# Altium project Servo-Driver-v2.0.PrjPcb (part 14 of 20)

## Sheet Controller-Comms-Sheet-2.SchDoc
size 420 x 297 mm; SheetNumber: 9; SheetTotal: 15
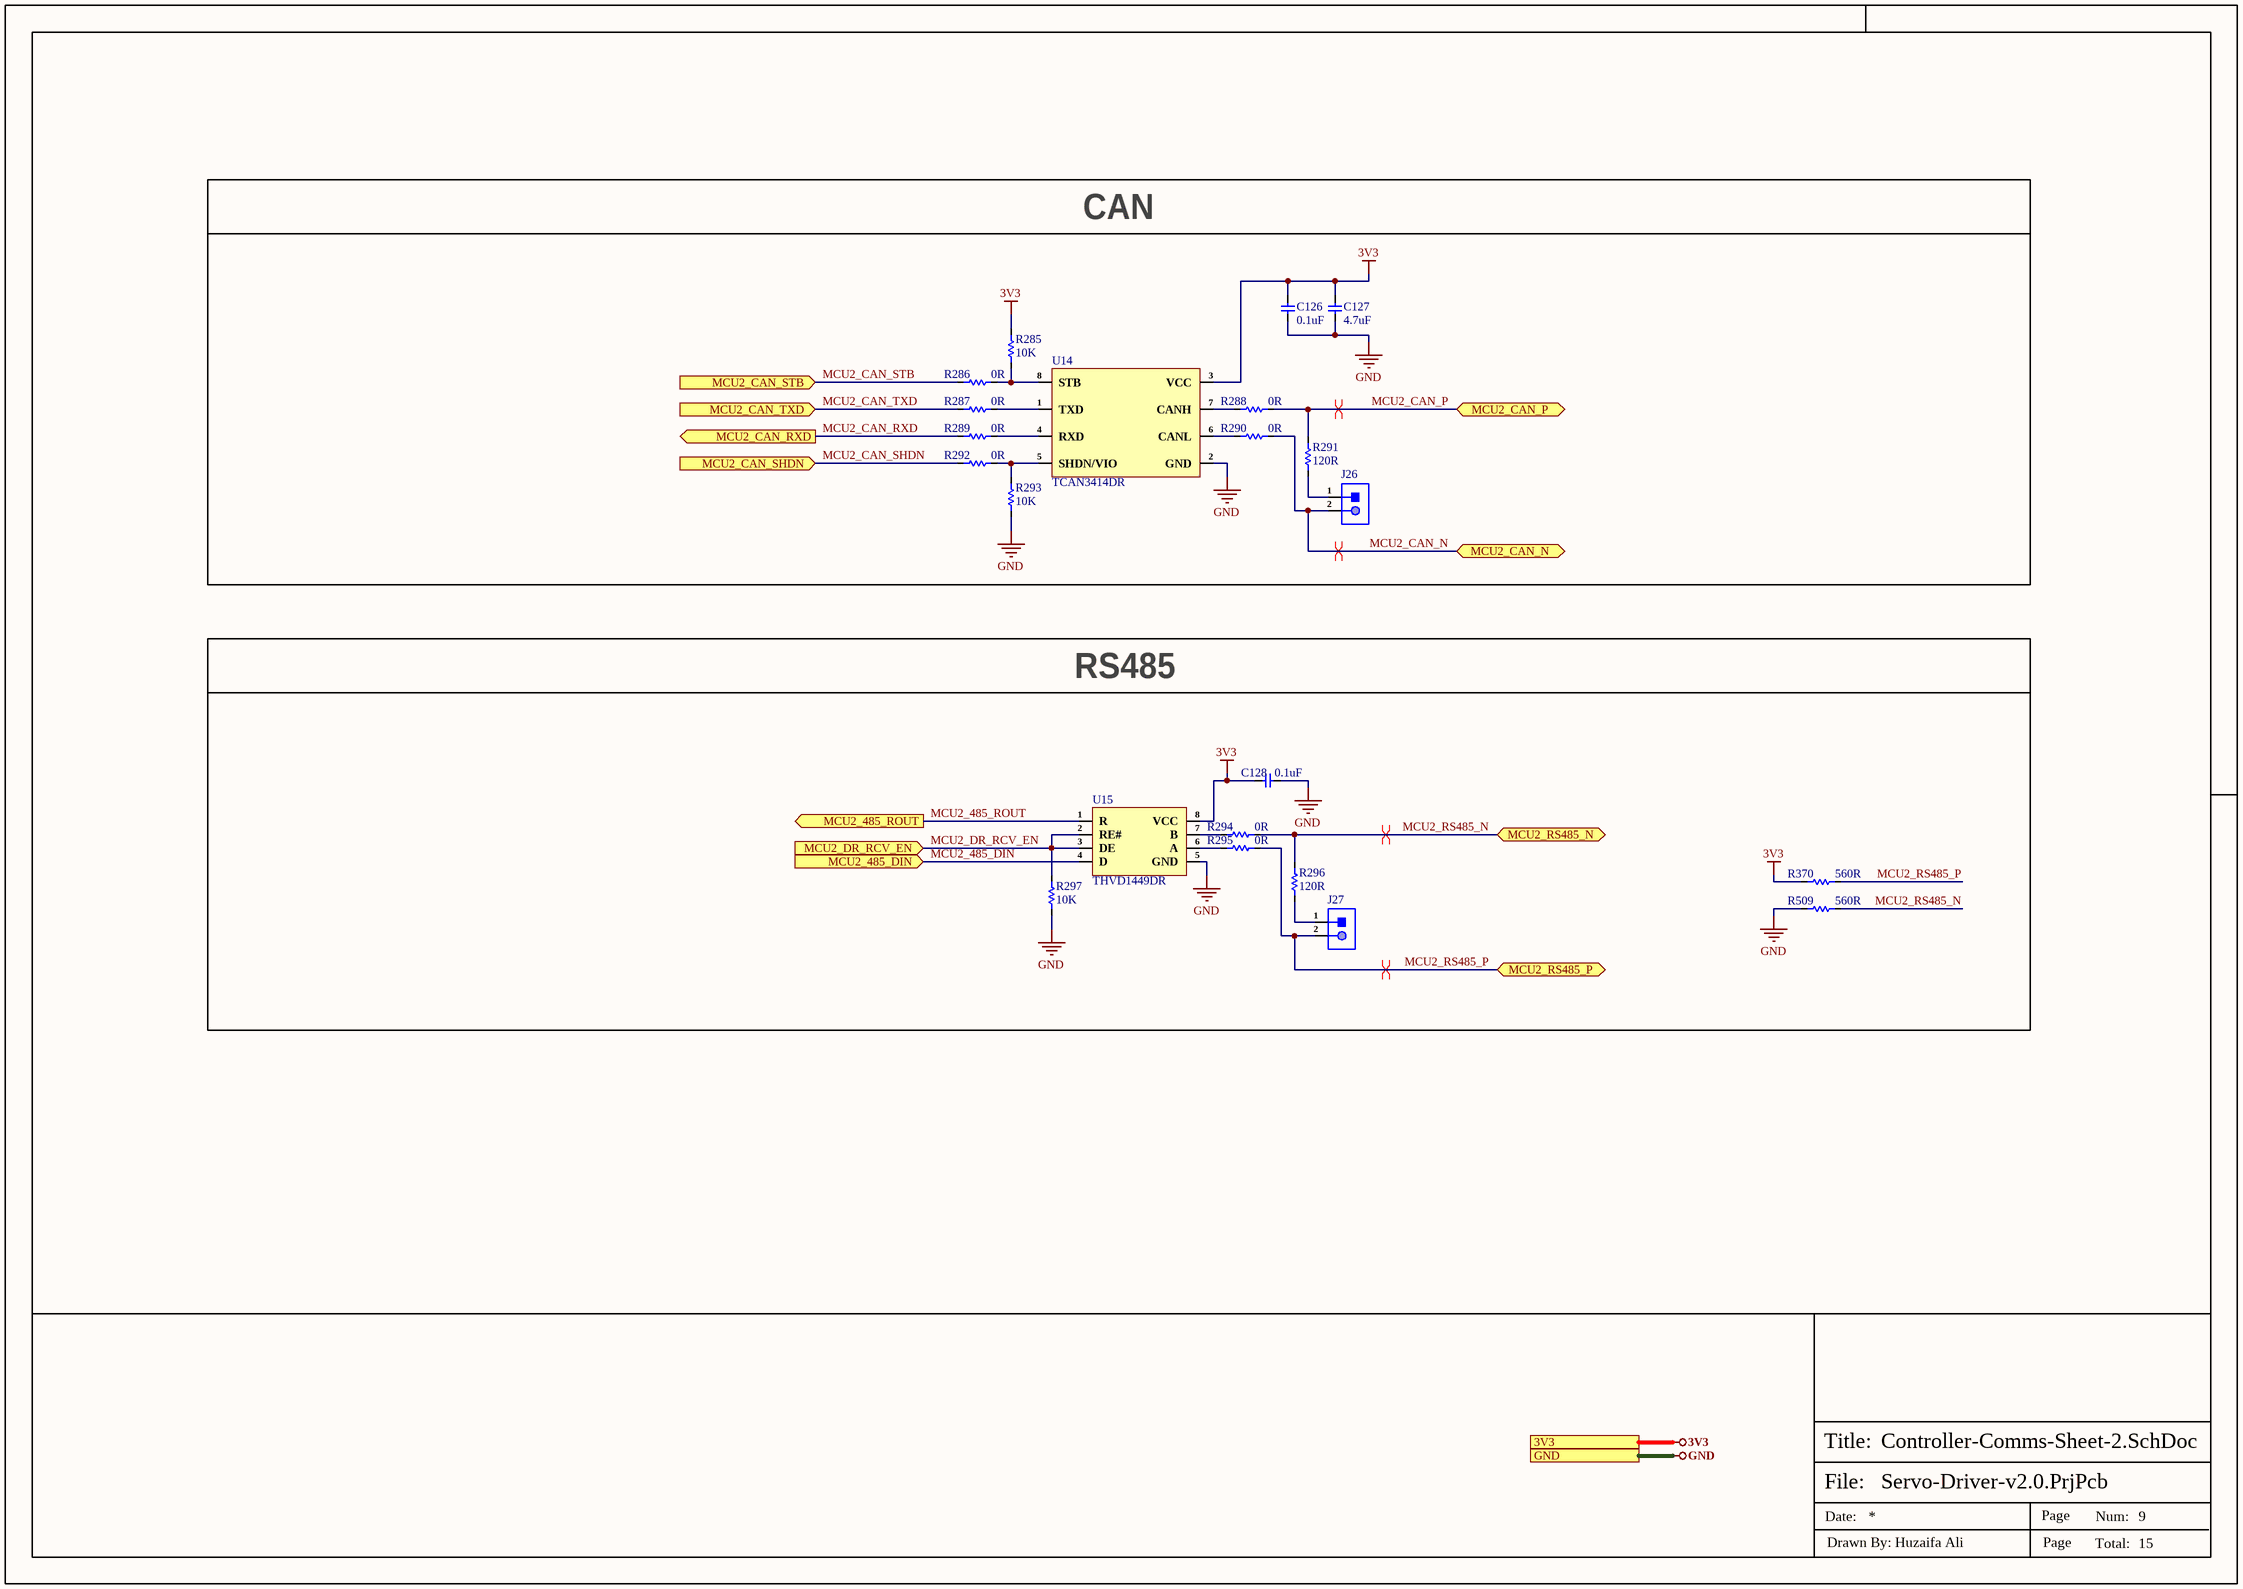
[diagram p10: Controller-Comms-Sheet-2.SchDoc]

### Parts
C126  0.1uF  [Cap-0402]
C127  4.7uF  [Cap-0402]
C128  0.1uF  [Cap-0402]
J26  X6511WV-02H-C60D30  [HDR1X2_]  (value not drawn)
J27  X6511WV-02H-C60D30  [HDR1X2_]  (value not drawn)
R285  10K  [Res-0402]
R286  0R  [Res-0402]
R287  0R  [Res-0402]
R288  0R  [Res-0402]
R289  0R  [Res-0402]
R290  0R  [Res-0402]
R291  120R  [Res-0603]
R292  0R  [Res-0402]
R293  10K  [Res-0402]
R294  0R  [Res-0402]
R295  0R  [Res-0402]
R296  120R  [Res-0603]
R297  10K  [Res-0402]
R370  560R  [Res-0402]
R509  560R  [Res-0402]
U14  TCAN3414DR  [SOIC-8(0.154", 3.90mm Width)]
U15  THVD1449DR  [SOIC-8(0.154", 3.90mm Width)]

### Blocks framed on the sheet
CAN: C126 C127 J26 R285-R293 U14
RS485: C128 J27 R294-R297 R370 R509 U15

### Ports
3V3, GND, MCU2_485_DIN (in), MCU2_485_ROUT (out), MCU2_CAN_N (bidir), MCU2_CAN_P (bidir), MCU2_CAN_RXD (out), MCU2_CAN_SHDN (in), MCU2_CAN_STB (in), MCU2_CAN_TXD (in), MCU2_DR_RCV_EN (in), MCU2_RS485_N (bidir), MCU2_RS485_P (bidir)

### Nets
3V3: C126.2 C127.2 C128.2 R285.2 R370.2 U14.3(VCC) U15.8(VCC) ; port 3V3
GND: C126.1 C127.1 C128.1 R293.1 R297.2 R509.2 U14.2(GND) U15.5(GND) ; port GND
MCU2_485_DIN: U15.4(D) ; port MCU2_485_DIN
MCU2_485_ROUT: U15.1(R) ; port MCU2_485_ROUT
MCU2_CAN_N: J26.2 R290.2 ; port MCU2_CAN_N  [project net CAN_N]
MCU2_CAN_P: R288.2 R291.2 ; port MCU2_CAN_P  [project net CAN_P]
MCU2_CAN_RXD: R289.1 ; port MCU2_CAN_RXD  [project net MCU2_CAN_RX]
MCU2_CAN_SHDN: R292.1 ; port MCU2_CAN_SHDN
MCU2_CAN_STB: R286.1 ; port MCU2_CAN_STB
MCU2_CAN_TXD: R287.1 ; port MCU2_CAN_TXD  [project net MCU2_CAN_TX]
MCU2_DR_RCV_EN: R297.1 U15.2(RE#) U15.3(DE) ; port MCU2_DR_RCV_EN
MCU2_RS485_N: R294.2 R296.2 R509.1 ; port MCU2_RS485_N  [project net MCU1_RS485_N]
MCU2_RS485_P: J27.2 R295.2 R370.1 ; port MCU2_RS485_P  [project net MCU1_RS485_P]
NetJ26_1: J26.1 R291.1
NetJ27_1: J27.1 R296.1
NetR285_1: R285.1 R286.2 U14.8(STB)
NetR287_2: R287.2 U14.1(TXD)
NetR288_1: R288.1 U14.7(CANH)
NetR289_2: R289.2 U14.4(RXD)
NetR290_1: R290.1 U14.6(CANL)
NetR292_2: R292.2 R293.2 U14.5(SHDN/VIO)
NetR294_1: R294.1 U15.7(B)
NetR295_1: R295.1 U15.6(A)

### Layout directives
differential pair; differential pair class DIFF_RS485: MCU1_RS485_N, MCU1_RS485_P
differential pair; differential pair class DIFF_CAN: CAN_N, CAN_P

### Notes on the sheet
- File:
- Title:
- Date:
- Page
- Num:
- Total:
- Drawn By: Huzaifa Ali

### Library data of the parts
C126 C128 = CC0402JRX7R7BB104: as C93 on sheet Controller-Driver-Sheet-2; Supplier: Digikey; Supplier Part Number: 311-1676-1-ND; Manufacturer Part Number: CC0402JRX7R7BB104; RoHS: Yes; Category: Ceramic Capacitors; Stock: 1659111; Pricing: 1=0.1, 10=0.046, 50=0.0262, 100=0.0203, 500=0.01528, 1000=0.012, 2500=0.01091, 5000=0.01004 (USD); Mounting Technology: Surface Mount; Case/Package: 0402; Case Code (Metric): 1005; Case Code (Imperial): 0402; Min Operating Temperature: -55°C; Max Operating Temperature: 125°C; Dielectric: X7R; Packaging: Tape and Reel; Package Quantity: 10000; Voltage Rating (DC): 16V; Voltage Rating: 16V; Series: CC; Construction: Flat; Length: 0.039inch; Width: 0.02inch; Height: 0.5mm; Thickness: 0.022inch; Lead Free: Lead Free; Halogen Free: Halogen Free; RoHS Compliant: Yes; ComponentLink1URL: https://datasheet.ciiva.com/13210/upy-gphc-x7r-6-3v-to-50v-8-12304-13210152.pdf?src-supplier=Mouser; ComponentLink1Description: https://datasheet.ciiva.com/13210/upy-gphc-x7r-6-3v-to-50v-8-12304-13210152.pdf?src-supplier=Mouser; LCSC Part Number: C541464
C127 = CC0402KRX5R6BB475: CAP CER 4.7UF 10V X5R 0402; Manufacturer: Yageo; Tolerance: 10%; Supplier 1: Farnell; Manufacturer Part Number: CC0402KRX5R6BB475; RoHS: Yes; Category: Ceramic Capacitors; Stock 1: 20000; Pricing 1: 10000=0.02310, 50000=0.02100 (GBP); Mount: Surface Mount; Case/Package: 0402; Case Code (Imperial): 0402; Case Code (Metric): 1005; Min Operating Temperature: -55°C; Max Operating Temperature: 85°C; Packaging: Cut Tape; Capacitance: 4.7uF; Voltage Rating: 10V; RoHS Compliant: Yes; ComponentLink1URL: http://www.yageo.com/documents/recent/UPY-GPHC_X5R_4V-to-50V_25.pdf?src-supplier=Digi-Key; ComponentLink1Description: http://www.yageo.com/documents/recent/UPY-GPHC_X5R_4V-to-50V_25.pdf?src-supplier=Digi-Key; Supplier Part Number 1: 3871698; LCSC Part Number: C326586
J26 J27 = X6511WV-02H-C60D30: as J18 on sheet Controller-Driver-Sheet-2; Manufacturer Part Number: X6511WV-02H-C60D30; Package: Plugin,P=2.54mm; LCSC Part Number: C706874; ComponentLink1Description: LCSC; ComponentLink1URL: https://www.lcsc.com/product-detail/Pin-Headers_XKB-Connectivity-X6511WV-02H-C60D30_C706874.html
R285 R293 R297 = RC0402FR-0710KL: as R160 on sheet Controller-Driver-Sheet-2; Supplier 1: Mouser; Manufacturer Part Number: RC0402FR-0710KL; RoHS: Yes; Category: Chip SMD Resistors; Stock 1: 18648329; Pricing 1: 1=0.10000, 10=0.01400, 50=0.01400, 100=0.00500, 1000=0.00300, 10000=0.00200 (USD); Case/Package: 0402; Number of Pins: 2; Case Code (Imperial): 0402; Case Code (Metric): 1005; Min Operating Temperature: -55°C; Max Operating Temperature: 155°C; Resistor Type: Thick Film; Tolerance: 1%; Packaging: Tape and Reel; Voltage Rating: 50V; Termination: SMD/SMT; Working Voltage: 50V; Number of Terminations: 2; Features: Moisture Resistant; Series: RC; Resistance Tolerance: 1%; Construction: Rectangular; Length: 1mm; Width: 0.5mm; Height: 0.32mm; Depth: 0.5mm; Lead Pitch: 0.2mm; REACH SVHC: No SVHC; Lead Free: Lead Free; RoHS Compliant: Yes; Military Standard: Not; ComponentLink1URL: https://datasheet.ciiva.com/7660/38568-7660787.pdf?src-supplier=Element14; ComponentLink1Description: https://datasheet.ciiva.com/7660/38568-7660787.pdf?src-supplier=Element14; ComponentLink2URL: https://datasheet.ciiva.com/7849/1686128-7849814.pdf?src-supplier=Element14; ComponentLink2Description: https://datasheet.ciiva.com/7849/1686128-7849814.pdf?src-supplier=Element14; ComponentLink3URL: https://datasheet.ciiva.com/7983/1018594-7983486.pdf?src-supplier=Element14; ComponentLink3Description: https://datasheet.ciiva.com/7983/1018594-7983486.pdf?src-supplier=Element14; ComponentLink4URL: https://datasheet.ciiva.com/22747/1018594-22747512.pdf?src-supplier=Element14; ComponentLink4Description: https://datasheet.ciiva.com/22747/1018594-22747512.pdf?src-supplier=Element14; ComponentLink5URL: https://datasheet.ciiva.com/12667/pyu-rc0402-51-rohs-l-6-r-12667067.pdf?src-supplier=Mouser; ComponentLink5Description: https://datasheet.ciiva.com/12667/pyu-rc0402-51-rohs-l-6-r-12667067.pdf?src-supplier=Mouser; ComponentLink6URL: https://datasheet.ciiva.com/7849/1784430-7849813.pdf?src-supplier=Element14; ComponentLink6Description: https://datasheet.ciiva.com/7849/1784430-7849813.pdf?src-supplier=Element14; ComponentLink7URL: https://datasheet.ciiva.com/7849/1784430-7849815.pdf?src-supplier=Element14; ComponentLink7Description: https://datasheet.ciiva.com/7849/1784430-7849815.pdf?src-supplier=Element14; Supplier Part Number 1: 603-RC0402FR-0710KL; LCSC Part Number: C60490
R286-R290 R292 R294 R295 = RC0402FR-070RL: as R161-R163 on sheet Controller-Driver-Sheet-2; Supplier 1: Mouser; Manufacturer Part Number: RC0402FR-070RL; RoHS: Yes; Stock 1: 8556842; Pricing 1: 1=0.10000, 10=0.01400, 50=0.01400, 100=0.00600, 1000=0.00300, 5000=0.00200, 10000=0.00100 (USD); Mount: Surface Mount; Case/Package: 0402; Contact Plating: Tin,Matte; Case Code (Imperial): 0402; Case Code (Metric): 1005; Size Code: 0402; Min Operating Temperature: -55°C; Max Operating Temperature: 155°C; Resistance: 0R; Resistor Type: Thick Film; Packaging: Tape and Reel; Termination: SMD/SMT; Features: Moisture Resistant; Series: RC; Number of Terminations: 2; Length: 1mm; Width: 0.5mm; Height: 0.35mm; Radiation Hardening: No; Lead Free: Lead Free; RoHS Compliant: Yes; ComponentLink1URL: https://datasheet.ciiva.com/8896/pyu-rc0402-51-rohs-l-6-8896149.pdf?src-supplier=Avnet; ComponentLink1Description: https://datasheet.ciiva.com/8896/pyu-rc0402-51-rohs-l-6-8896149.pdf?src-supplier=Avnet; ComponentLink2URL: https://datasheet.ciiva.com/16790/pyu-rc0402-51-rohs-l-6-r-16790444.pdf?src-supplier=Future+Electronics; ComponentLink2Description: https://datasheet.ciiva.com/16790/pyu-rc0402-51-rohs-l-6-r-16790444.pdf?src-supplier=Future+Electronics; Supplier Part Number 1: 603-RC0402FR-070RL; LCSC Part Number: C106231
R291 R296 = RC0603FR-07120RL: as R272 on sheet MOSFET-Motor-Sheet-2; Supplier 1: Digi-Key; Manufacturer Part Number: RC0603FR-07120RL; RoHS: Yes; Category: Chip SMD Resistors; Stock 1: 839061; Pricing 1: 1=0.10000, 10=0.02400, 100=0.00970, 1000=0.00436, 2500=0.00378 (USD); Case/Package: 0603; Number of Pins: 2; Case Code (Metric): 1608; Case Code (Imperial): 0603; Size Code: 0603; Min Operating Temperature: -55°C; Max Operating Temperature: 155°C; Resistance: 120R; Tolerance: 1%; Resistor Type: Thick Film; Packaging: Tape and Reel; Voltage Rating: 50V; Package Quantity: 1; Number of Terminations: 2; Termination: SMD/SMT; Max Power Dissipation: 100mW; Features: Moisture Resistant; Series: RC; Construction: Rectangular; Resistance Tolerance: 1%; Length: 1.6mm; Width: 0.031inch; Height: 0.022inch; Depth: 0.8mm; REACH SVHC: No SVHC; Lead Free: Lead Free; Military Standard: Not; RoHS Compliant: Yes; ComponentLink1URL: https://datasheet.ciiva.com/2553/pyu-r-int-thick-7-2553512.pdf?src-supplier=Digi-Key; ComponentLink1Description: https://datasheet.ciiva.com/2553/pyu-r-int-thick-7-2553512.pdf?src-supplier=Digi-Key; ComponentLink2URL: https://datasheet.ciiva.com/7746/443971-7746248.pdf?src-supplier=Element14; ComponentLink2Description: https://datasheet.ciiva.com/7746/443971-7746248.pdf?src-supplier=Element14; ComponentLink3URL: https://datasheet.ciiva.com/2553/pyu-r-int-thick-7-2553513.pdf?src-supplier=Digi-Key; ComponentLink3Description: https://datasheet.ciiva.com/2553/pyu-r-int-thick-7-2553513.pdf?src-supplier=Digi-Key; ComponentLink4URL: https://datasheet.ciiva.com/7746/443971-7746249.pdf?src-supplier=Element14; ComponentLink4Description: https://datasheet.ciiva.com/7746/443971-7746249.pdf?src-supplier=Element14; ComponentLink5URL: https://datasheet.ciiva.com/2553/pyu-r-int-thick-7-2553514.pdf?src-supplier=Digi-Key; ComponentLink5Description: https://datasheet.ciiva.com/2553/pyu-r-int-thick-7-2553514.pdf?src-supplier=Digi-Key; ComponentLink6URL: https://datasheet.ciiva.com/46395/443971-46395021.pdf?src-supplier=Element14; ComponentLink6Description: https://datasheet.ciiva.com/46395/443971-46395021.pdf?src-supplier=Element14; Supplier Part Number 1: 311-120HRCT-ND; LCSC Part Number: C114640
R370 R509 = RC0402FR-07560RL: RES 560 OHM 1% 1/16W 0402; Manufacturer: Yageo; Power Rating: 63mW; Temperature Coefficient: 100ppm/°C; Voltage Rating: 50V; Item Type: Resistor; Supplier: Future Electronics; Supplier Part Number: 8872046; Manufacturer Part Number: RC0402FR-07560RL; RoHS: Yes; Category: Chip SMD Resistors; Stock: 1360000; Pricing: 10000=0.0012, 100000=0.0011, 300000=0.0011, 1250000=0.001, 3000000=0.0009 (USD); Case/Package: 0402; Case Code (Metric): 1005; Case Code (Imperial): 0402; Min Operating Temperature: -55°C; Max Operating Temperature: 155°C; Tolerance: 1%; Packaging: Tape and Reel; Value: 560R; Package Quantity: 1; Resistor Type: Thick Film; Number of Terminations: 2; Termination: SMD/SMT; Max Power Dissipation: 63mW; Features: Moisture Resistant; Series: RC; Construction: Rectangular; Resistance Tolerance: 1%; Length: 1mm; Width: 0.02inch; Height: 0.016inch; Depth: 0.5mm; RoHS Compliant: Yes; Military Standard: Not; Lead Free: Lead Free; Reach SVHC Compliant: Unknown; ComponentLink1URL: https://datasheet.ciiva.com/2453/pyu-r-int-thick-7-2453458.pdf?src-supplier=Digikey; ComponentLink1Description: https://datasheet.ciiva.com/2453/pyu-r-int-thick-7-2453458.pdf?src-supplier=Digikey; ComponentLink2URL: https://datasheet.ciiva.com/2453/pyu-r-int-thick-7-2453459.pdf?src-supplier=Digikey; ComponentLink2Description: https://datasheet.ciiva.com/2453/pyu-r-int-thick-7-2453459.pdf?src-supplier=Digikey; ComponentLink3URL: https://datasheet.ciiva.com/2453/pyu-r-int-thick-7-2453457.pdf?src-supplier=Digikey; ComponentLink3Description: https://datasheet.ciiva.com/2453/pyu-r-int-thick-7-2453457.pdf?src-supplier=Digikey; ComponentLink4URL: https://datasheet.ciiva.com/12558/pyu-rc0402-51-rohs-l-6-r-8721-12558383.pdf?src-supplier=Mouser; ComponentLink4Description: https://datasheet.ciiva.com/12558/pyu-rc0402-51-rohs-l-6-r-8721-12558383.pdf?src-supplier=Mouser; ComponentLink5URL: https://datasheet.ciiva.com/7850/1018594-7850042.pdf?src-supplier=Element14; ComponentLink5Description: https://datasheet.ciiva.com/7850/1018594-7850042.pdf?src-supplier=Element14; ComponentLink6URL: https://datasheet.ciiva.com/7850/1018594-7850043.pdf?src-supplier=Element14; ComponentLink6Description: https://datasheet.ciiva.com/7850/1018594-7850043.pdf?src-supplier=Element14; LCSC Part Number: C163460
U14 = TCAN3414DR: IC TRANSCEIVER HALF 1/1 8SOIC; Manufacturer: Texas Instruments; Supplier: Mouser; LCSC Part Number: C22396693; Manufacturer Part Number: TCAN3414DR; RoHS: No; Item Type: IC; Stock: 201; Pricing: 1=1.55, 10=1.1, 50=1.1, 100=0.895, 1000=0.763, 10000=0.681 (USD); Case/Package: SOIC; Pins: 8; Length: 4.9mm; Width: 3.91mm; Height: 1.75mm; Thickness: 1.58mm
U15 = THVD1449DR: as U13 on sheet MOSFET-Motor-Sheet-2; Supplier: Mouser; LCSC Part Number: C3235059; Manufacturer Part Number: THVD1449DR; RoHS: No; Item Type: IC; Stock: 7454; Pricing: 1=3.62, 10=2.51, 50=2.51, 100=2.27, 1000=2.02, 10000=1.95 (USD)

## Sheet Controller-Driver-Sheet-1.SchDoc
size 420 x 297 mm; SheetNumber: 4; SheetTotal: 15
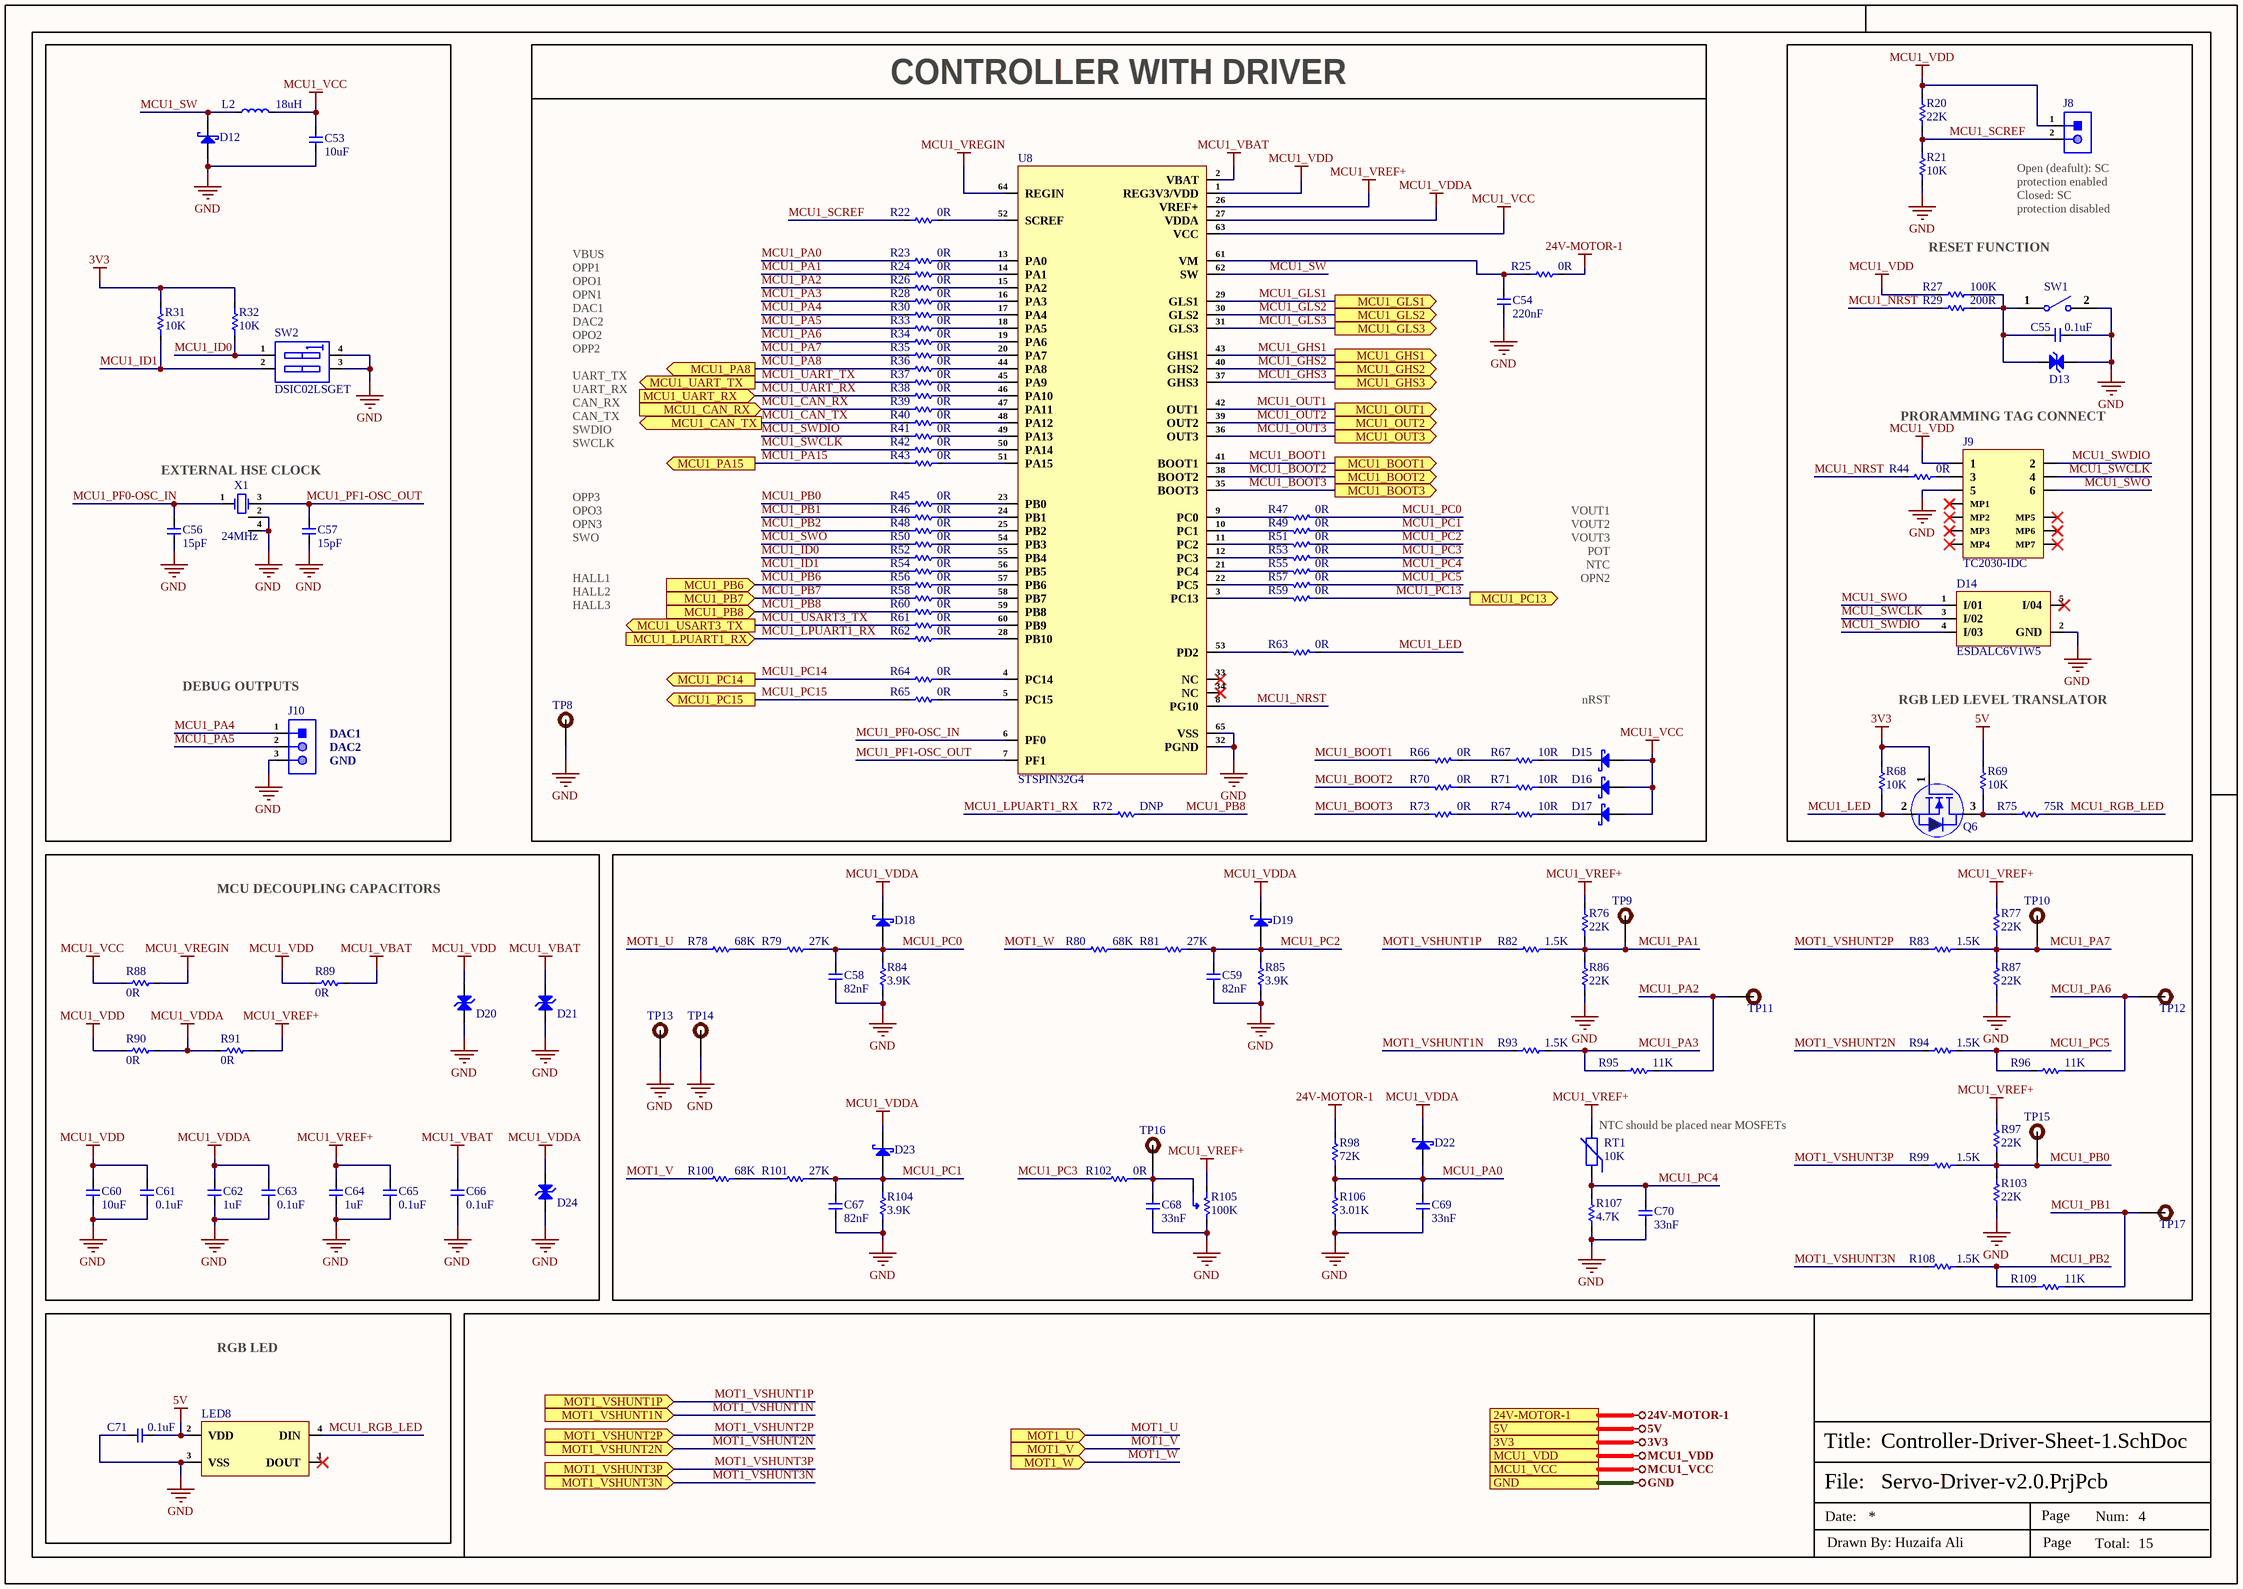
[diagram p11: Controller-Driver-Sheet-1.SchDoc]

### Parts
C53  10uF  [Cap-0805]
C54  220nF  [Cap-0805]
C55  0.1uF  [Cap-0402]
C56  15pF  [Cap-0201]
C57  15pF  [Cap-0201]
C58  82nF  [Cap-0603]
C59  82nF  [Cap-0603]
C60  10uF  [Cap-0603]
C61  0.1uF  [Cap-0402]
C62  1uF  [Cap-0402]
C63  0.1uF  [Cap-0402]
C64  1uF  [Cap-0402]
C65  0.1uF  [Cap-0402]
C66  0.1uF  [Cap-0402]
C67  82nF  [Cap-0603]
C68  33nF  [Cap-0603]
C69  33nF  [Cap-0603]
C70  33nF  [Cap-0603]
C71  0.1uF  [Cap-0402]
D12  STPS1H100A  [SMA]  (value not drawn)
D13  ESDM2033MX4T5G  [DFN-2(0.3x0.6)]  (value not drawn)
D14  ESDALC6V1W5  [SOT-323-5]
D15  BAT46ZFILM  [SOD-123]  (value not drawn)
D16  BAT46ZFILM  [SOD-123]  (value not drawn)
D17  BAT46ZFILM  [SOD-123]  (value not drawn)
D18  BAT30KFILM  [SOD-523]  (value not drawn)
D19  BAT30KFILM  [SOD-523]  (value not drawn)
D20  ESDM2033MX4T5G  [DFN-2(0.3x0.6)]  (value not drawn)
D21  ESDM2033MX4T5G  [DFN-2(0.3x0.6)]  (value not drawn)
D22  BAT30KFILM  [SOD-523]  (value not drawn)
D23  BAT30KFILM  [SOD-523]  (value not drawn)
D24  ESDM2033MX4T5G  [DFN-2(0.3x0.6)]  (value not drawn)
J8  X6511WV-02H-C60D30  [HDR1X2_]  (value not drawn)
J9  TC2030-IDC  [TC2030-IDC_]
J10  X6511WV-03H-C60D30  [HDR1X3_]  (value not drawn)
L2  18uH  [FNR5040S180MT]
LED8  WS2812D-F5  [WS2812D-F5]  (value not drawn)
Q6  Si2302CDS  [Sot-23]  (value not drawn)
R20  22K  [Res-0402]
R21  10K  [Res-0402]
R22  0R  [Res-0402]
R23  0R  [Res-0402]
R24  0R  [Res-0402]
R25  0R  [Res-0805]
R26  0R  [Res-0402]
R27  100K  [Res-0402]
R28  0R  [Res-0402]
R29  200R  [Res-0402]
R30  0R  [Res-0402]
R31  10K  [Res-0402]
R32  10K  [Res-0402]
R33  0R  [Res-0402]
R34  0R  [Res-0402]
R35  0R  [Res-0402]
R36  0R  [Res-0402]
R37  0R  [Res-0402]
R38  0R  [Res-0402]
R39  0R  [Res-0402]
R40  0R  [Res-0402]
R41  0R  [Res-0402]
R42  0R  [Res-0402]
R43  0R  [Res-0402]
R44  0R  [Res-0402]
R45  0R  [Res-0402]
R46  0R  [Res-0402]
R47  0R  [Res-0402]
R48  0R  [Res-0402]
R49  0R  [Res-0402]
R50  0R  [Res-0402]
R51  0R  [Res-0402]
R52  0R  [Res-0402]
R53  0R  [Res-0402]
R54  0R  [Res-0402]
R55  0R  [Res-0402]
R56  0R  [Res-0402]
R57  0R  [Res-0402]
R58  0R  [Res-0402]
R59  0R  [Res-0402]
R60  0R  [Res-0402]
R61  0R  [Res-0402]
R62  0R  [Res-0402]
R63  0R  [Res-0402]
R64  0R  [Res-0402]
R65  0R  [Res-0402]
R66  0R  [Res-0402]
R67  10R  [Res-0603]
R68  10K  [Res-0402]
R69  10K  [Res-0402]
R70  0R  [Res-0402]
R71  10R  [Res-0603]
R72  DNP  [Res-0402]
R73  0R  [Res-0402]
R74  10R  [Res-0603]
R75  75R  [Res-0402]
R76  22K  [Res-0402]
R77  22K  [Res-0402]
R78  68K  [Res-0603]
R79  27K  [Res-0603]
R80  68K  [Res-0603]
R81  27K  [Res-0603]
R82  1.5K  [Res-0402]
R83  1.5K  [Res-0402]
R84  3.9K  [Res-0603]
R85  3.9K  [Res-0603]
R86  22K  [Res-0402]
R87  22K  [Res-0402]
R88  0R  [Res-0805]
R89  0R  [Res-0805]
R90  0R  [Res-0805]
R91  0R  [Res-0805]
R93  1.5K  [Res-0402]
R94  1.5K  [Res-0402]
R95  11K  [Res-0402]
R96  11K  [Res-0402]
R97  22K  [Res-0402]
R98  72K  [Res-0603]
R99  1.5K  [Res-0402]
R100  68K  [Res-0603]
R101  27K  [Res-0603]
R102  0R  [Res-0805]
R103  22K  [Res-0402]
R104  3.9K  [Res-0603]
R105  100K  [3386P-1-104TLF]
R106  3.01K  [Res-0603]
R107  4.7K  [Res-0402]
R108  1.5K  [Res-0402]
R109  11K  [Res-0402]
RT1  10K  [Res-0603]
SW1  B3U-1000P  [B3U-1000P]  (value not drawn)
SW2  DSIC02LSGET  [DSIC02LSGET]
TP8  TEST POINT  [Test-point]  (value not drawn)  (no BOM)
TP9  TEST POINT  [Test-point]  (value not drawn)  (no BOM)
TP10  TEST POINT  [Test-point]  (value not drawn)  (no BOM)
TP11  TEST POINT  [Test-point]  (value not drawn)  (no BOM)
TP12  TEST POINT  [Test-point]  (value not drawn)  (no BOM)
TP13  TEST POINT  [Test-point]  (value not drawn)  (no BOM)
TP14  TEST POINT  [Test-point]  (value not drawn)  (no BOM)
TP15  TEST POINT  [Test-point]  (value not drawn)  (no BOM)
TP16  TEST POINT  [Test-point]  (value not drawn)  (no BOM)
TP17  TEST POINT  [Test-point]  (value not drawn)  (no BOM)
U8  STSPIN32G4  [64-VFQFPN 9X9]
X1  24MHz  [SMD2016-4P]

### Blocks framed on the sheet
CONTROLLER WITH DRIVER: C54 D15-D17 R22-R26 R28 R30 R33-R43 R45-R67 R70-R74 TP8 U8
MCU DECOUPLING CAPACITORS: C60-C66 D20 D21 D24 R88-R91
NTC should be placed near MOSFETs: C58 C59 C67-C70 D18 D19 D22 D23 R76-R87 R93-R109 RT1 TP9-TP17
RGB LED: C71 LED8

### Ports
3V3, 5V, 24V-MOTOR-1, GND, MCU1_BOOT1 (out), MCU1_BOOT2 (out), MCU1_BOOT3 (out), MCU1_CAN_RX (in), MCU1_CAN_TX (out), MCU1_GHS1 (out), MCU1_GHS2 (out), MCU1_GHS3 (out), MCU1_GLS1 (out), MCU1_GLS2 (out), MCU1_GLS3 (out), MCU1_LPUART1_RX (in), MCU1_OUT1 (out), MCU1_OUT2 (out), MCU1_OUT3 (out), MCU1_PA8 (out), MCU1_PA15 (out), MCU1_PB6 (in), MCU1_PB7 (in), MCU1_PB8 (in), MCU1_PC13 (out), MCU1_PC14 (out), MCU1_PC15 (out), MCU1_UART_RX (in), MCU1_UART_TX (out), MCU1_USART3_TX (out), MCU1_VCC, MCU1_VDD, MOT1_U (in), MOT1_V (in), MOT1_VSHUNT1N (in), MOT1_VSHUNT1P (in), MOT1_VSHUNT2N (in), MOT1_VSHUNT2P (in), MOT1_VSHUNT3N (in), MOT1_VSHUNT3P (in), MOT1_W (in)

### Nets
3V3: Q6.1(G) R31.2 R32.2 R68.2 ; port 3V3
5V: C71.2 LED8.2(VDD) R69.2 ; port 5V
24V-MOTOR-1: R25.2 R98.2 ; port 24V-MOTOR-1
GND: C53.1 C54.1 C55.1 C56.1 C57.1 C58.1 C59.1 C60.1 C61.1 C62.1 C63.1 C64.1 C65.1 C66.1 C67.1 C68.1 C69.1 C70.1 C71.1 D12.2(A) D13.1(A) D14.2(GND) D20.1(A) D21.1(A) D24.1(A) J9.5 J10.3 LED8.3(VSS) R21.1 R84.1 R85.1 R86.1 R87.1 R103.1 R104.1 R105.3(CW) R106.1 R107.1 SW1.2 SW2.3(A3) SW2.4(B3) TP8.1 TP13.1 TP14.1 U8.32(PGND) U8.65(VSS) X1.2(GND) X1.4(GND) ; port GND
MCU1_VBAT: C66.2 D21.2(A) R89.2 U8.2(VBAT)
MCU1_VCC: C53.2 D15.1(A) D16.1(A) D17.1(A) L2.2 R88.1 U8.63(VCC) ; port MCU1_VCC
MCU1_VDD: C60.2 C61.2 D20.2(A) J8.1 J9.1 R20.2 R27.1 R89.1 R90.1 U8.1(REG3V3/VDD) ; port MCU1_VDD
MCU1_VDDA: C62.2 C63.2 D18.2(K) D19.2(K) D22.2(K) D23.2(K) D24.2(A) R90.2 R91.1 U8.27(VDDA)
MCU1_VREF+: C64.2 C65.2 R76.2 R77.2 R91.2 R97.2 R105.1(CCW) RT1.2 U8.26(VREF+)
MCU1_VREGIN: R88.2 U8.64(REGIN)
MCU1_BOOT1: R66.1 U8.41(BOOT1) ; port MCU1_BOOT1
MCU1_BOOT2: R70.1 U8.38(BOOT2) ; port MCU1_BOOT2
MCU1_BOOT3: R73.1 U8.35(BOOT3) ; port MCU1_BOOT3
MCU1_CAN_RX: R39.2 ; port MCU1_CAN_RX
MCU1_CAN_TX: R40.2 ; port MCU1_CAN_TX
MCU1_GHS1: U8.43(GHS1) ; port MCU1_GHS1
MCU1_GHS2: U8.40(GHS2) ; port MCU1_GHS2
MCU1_GHS3: U8.37(GHS3) ; port MCU1_GHS3
MCU1_GLS1: U8.29(GLS1) ; port MCU1_GLS1
MCU1_GLS2: U8.30(GLS2) ; port MCU1_GLS2
MCU1_GLS3: U8.31(GLS3) ; port MCU1_GLS3
MCU1_ID0: R32.1 R52.2 SW2.1(A1)
MCU1_ID1: R31.1 R54.2 SW2.2(A2)
MCU1_LED: Q6.2(S) R63.2 R68.1
MCU1_LPUART1_RX: R62.2 R72.2 ; port MCU1_LPUART1_RX  [project net MCU1_485_ROUT]
MCU1_NRST: R29.1 R44.2 U8.8(PG10)
MCU1_OUT1: U8.42(OUT1) ; port MCU1_OUT1
MCU1_OUT2: U8.39(OUT2) ; port MCU1_OUT2
MCU1_OUT3: U8.36(OUT3) ; port MCU1_OUT3
MCU1_PA0: C69.2 D22.1(A) R23.2 R98.1 R106.2
MCU1_PA1: R24.2 R76.1 R82.2 R86.2 TP9.1
MCU1_PA2: R26.2 R95.2 TP11.1
MCU1_PA3: R28.2 R93.2 R95.1
MCU1_PA4: J10.1 R30.2
MCU1_PA5: J10.2 R33.2
MCU1_PA6: R34.2 R96.2 TP12.1
MCU1_PA7: R35.2 R77.1 R83.2 R87.2 TP10.1
MCU1_PA8: R36.2 ; port MCU1_PA8
MCU1_PA15: R43.2 ; port MCU1_PA15
MCU1_PB0: R45.2 R97.1 R99.2 R103.2 TP15.1
MCU1_PB1: R46.2 R109.2 TP17.1
MCU1_PB2: R48.2 R108.2 R109.1
MCU1_PB6: R56.2 ; port MCU1_PB6  [project net MCU1_HALL1]
MCU1_PB7: R58.2 ; port MCU1_PB7  [project net MCU1_HALL2]
MCU1_PB8: R60.2 R72.1 ; port MCU1_PB8  [project net MCU1_HALL3]
MCU1_PC0: C58.2 D18.1(A) R47.2 R79.2 R84.2
MCU1_PC1: C67.2 D23.1(A) R49.2 R101.2 R104.2
MCU1_PC2: C59.2 D19.1(A) R51.2 R81.2 R85.2
MCU1_PC3: R53.2 R102.1
MCU1_PC4: C70.2 R55.2 R107.2 RT1.1
MCU1_PC5: R57.2 R94.2 R96.1
MCU1_PC13: R59.2 ; port MCU1_PC13  [project net MCU1_DR_RCV_EN]
MCU1_PC14: R64.2 ; port MCU1_PC14  [project net MCU1_CAN_SHDN]
MCU1_PC15: R65.2 ; port MCU1_PC15  [project net MCU1_CAN_STB]
MCU1_PF0-OSC_IN: C56.2 U8.6(PF0) X1.1(OSC1)
MCU1_PF1-OSC_OUT: C57.2 U8.7(PF1) X1.3(OSC2)
MCU1_RGB_LED: LED8.4(DIN) R75.2
MCU1_SCREF: J8.2 R20.1 R21.2 R22.2
MCU1_SW: D12.1(K) L2.1 U8.62(SW)
MCU1_SWCLK: D14.3(I/02) J9.4 R42.2
MCU1_SWDIO: D14.4(I/03) J9.2 R41.2
MCU1_SWO: D14.1(I/01) J9.6 R50.2
MCU1_UART_RX: R38.2 ; port MCU1_UART_RX
MCU1_UART_TX: R37.2 ; port MCU1_UART_TX
MCU1_USART3_TX: R61.2 ; port MCU1_USART3_TX  [project net MCU1_485_DIN]
MOT1_U: R78.1 ; port MOT1_U
MOT1_V: R100.1 ; port MOT1_V
MOT1_VSHUNT1N: R93.1 ; port MOT1_VSHUNT1N
MOT1_VSHUNT1P: R82.1 ; port MOT1_VSHUNT1P
MOT1_VSHUNT2N: R94.1 ; port MOT1_VSHUNT2N
MOT1_VSHUNT2P: R83.1 ; port MOT1_VSHUNT2P
MOT1_VSHUNT3N: R108.1 ; port MOT1_VSHUNT3N
MOT1_VSHUNT3P: R99.1 ; port MOT1_VSHUNT3P
MOT1_W: R80.1 ; port MOT1_W
NetC54_2: C54.2 R25.1 U8.61(VM)
NetC55_2: C55.2 D13.2(A) R27.2 R29.2 SW1.1
NetC68_2: C68.2 R102.2 R105.2(Wiper) TP16.1
NetD15_2: D15.2(K) R67.2
NetD16_2: D16.2(K) R71.2
NetD17_2: D17.2(K) R74.2
NetJ9_3: J9.3 R44.1
NetQ6_3: Q6.3(D) R69.1 R75.1
NetR22_1: R22.1 U8.52(SCREF)
NetR23_1: R23.1 U8.13(PA0)
NetR24_1: R24.1 U8.14(PA1)
NetR26_1: R26.1 U8.15(PA2)
NetR28_1: R28.1 U8.16(PA3)
NetR30_1: R30.1 U8.17(PA4)
NetR33_1: R33.1 U8.18(PA5)
NetR34_1: R34.1 U8.19(PA6)
NetR35_1: R35.1 U8.20(PA7)
NetR36_1: R36.1 U8.44(PA8)
NetR37_1: R37.1 U8.45(PA9)
NetR38_1: R38.1 U8.46(PA10)
NetR39_1: R39.1 U8.47(PA11)
NetR40_1: R40.1 U8.48(PA12)
NetR41_1: R41.1 U8.49(PA13)
NetR42_1: R42.1 U8.50(PA14)
NetR43_1: R43.1 U8.51(PA15)
NetR45_1: R45.1 U8.23(PB0)
NetR46_1: R46.1 U8.24(PB1)
NetR47_1: R47.1 U8.9(PC0)
NetR48_1: R48.1 U8.25(PB2)
NetR49_1: R49.1 U8.10(PC1)
NetR50_1: R50.1 U8.54(PB3)
NetR51_1: R51.1 U8.11(PC2)
NetR52_1: R52.1 U8.55(PB4)
NetR53_1: R53.1 U8.12(PC3)
NetR54_1: R54.1 U8.56(PB5)
NetR55_1: R55.1 U8.21(PC4)
NetR56_1: R56.1 U8.57(PB6)
NetR57_1: R57.1 U8.22(PC5)
NetR58_1: R58.1 U8.58(PB7)
NetR59_1: R59.1 U8.3(PC13)
NetR60_1: R60.1 U8.59(PB8)
NetR61_1: R61.1 U8.60(PB9)
NetR62_1: R62.1 U8.28(PB10)
NetR63_1: R63.1 U8.53(PD2)
NetR64_1: R64.1 U8.4(PC14)
NetR65_1: R65.1 U8.5(PC15)
NetR66_2: R66.2 R67.1
NetR70_2: R70.2 R71.1
NetR73_2: R73.2 R74.1
NetR78_2: R78.2 R79.1
NetR80_2: R80.2 R81.1
NetR100_2: R100.2 R101.1

Not connected (* = marked no-connect by the designer): D14 5(I/04)*; J9 MP1* MP2* MP3* MP4* MP5* MP6* MP7*; LED8 1(DOUT)*; U8 33(NC)* 34(NC)*

### Notes on the sheet
- VBUS
- OPP1
- RESET FUNCTION
- (near J8) Open (deafult): SC protection enabled
  Closed: SC protection disabled
- OPO1
- OPN1
- DAC1
- DAC2
- OPO2
- OPP2
- UART_TX
- UART_RX
- CAN_RX
- CAN_TX
- SWDIO
- SWCLK
- PRORAMMING TAG CONNECT
- (near X1) EXTERNAL HSE CLOCK
- OPP3
- OPO3
- OPN3
- SWO
- VOUT1
- VOUT2
- VOUT3
- HALL1
- HALL2
- POT
- NTC
- OPN2
- HALL3
- (near J10) DEBUG OUTPUTS
- (near J10) DAC1
- nRST
- RGB LED LEVEL TRANSLATOR
- (near J10) DAC2
- (near J10) GND
- File:
- Title:
- Date:
- Page
- Num:
- Total:
- Drawn By: Huzaifa Ali